# Altium schematic sheet P1.schdoc
size 297 x 209 mm; Symbol: Drawing-Symbol_A4; @Project Name: Macropad; @Page Count: 1; @Update Date: 2026-11-06; @Create Date: 2026-11-06; @Schematic Name: Schematic1; @Page No: 1; @Page Name: P1; Company: EasyEDA.com; Version: V1.0; Page Size: A4; Device: Drawing-Symbol_A4; @Create Time: 21:02:07; @Update Time: 21:02:07; Border: 1; Width: 1170; Height: 825; Region Start: 1; X Region Count: 6; Y Region Count: 4; Blade Width: 10; Title Block Position: 3; @Board Name: Board1
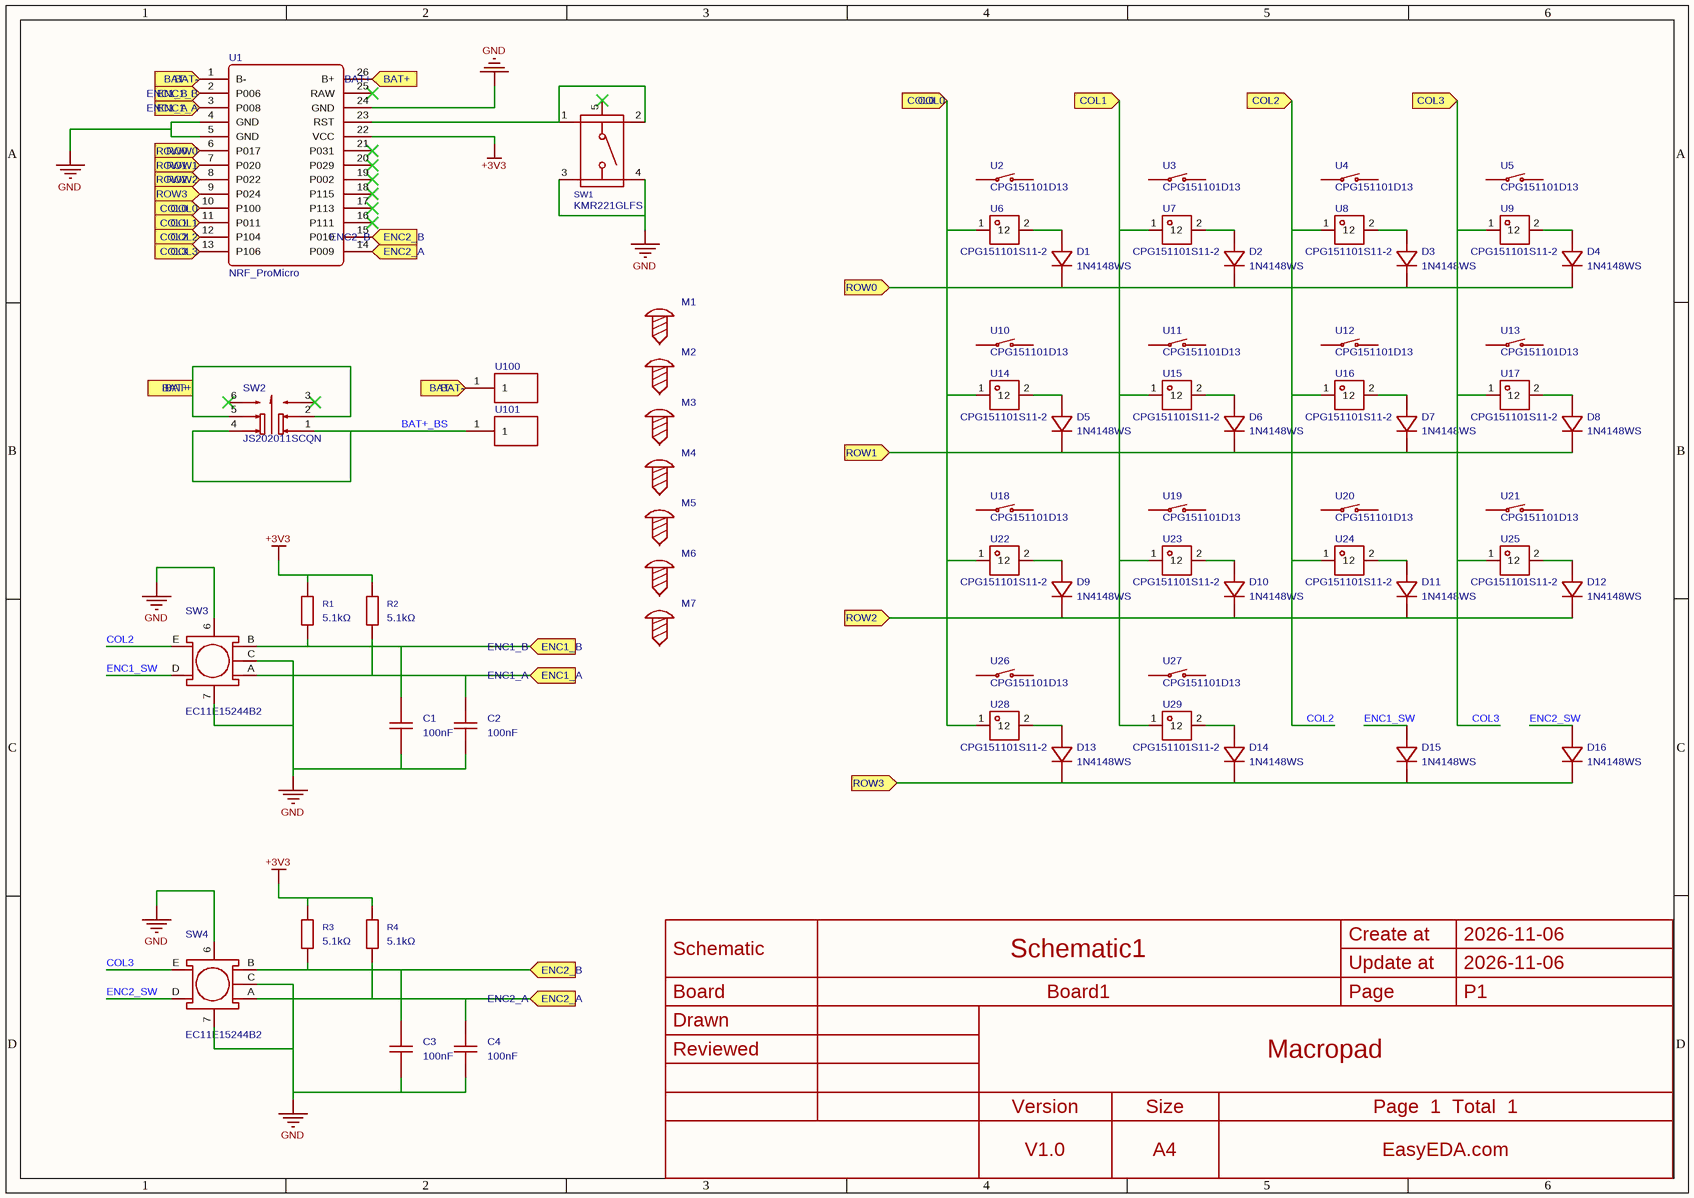
[diagram p0: P1.schdoc]

## Parts
C1  100nF  [C0402]
C2  100nF  [C0402]
C3  100nF  [C0402]
C4  100nF  [C0402]
D1  1N4148WS  [SOD-323_L1.8-W1.3-LS2.5-RD]
D2  1N4148WS  [SOD-323_L1.8-W1.3-LS2.5-RD]
D3  1N4148WS  [SOD-323_L1.8-W1.3-LS2.5-RD]
D4  1N4148WS  [SOD-323_L1.8-W1.3-LS2.5-RD]
D5  1N4148WS  [SOD-323_L1.8-W1.3-LS2.5-RD]
D6  1N4148WS  [SOD-323_L1.8-W1.3-LS2.5-RD]
D7  1N4148WS  [SOD-323_L1.8-W1.3-LS2.5-RD]
D8  1N4148WS  [SOD-323_L1.8-W1.3-LS2.5-RD]
D9  1N4148WS  [SOD-323_L1.8-W1.3-LS2.5-RD]
D10  1N4148WS  [SOD-323_L1.8-W1.3-LS2.5-RD]
D11  1N4148WS  [SOD-323_L1.8-W1.3-LS2.5-RD]
D12  1N4148WS  [SOD-323_L1.8-W1.3-LS2.5-RD]
D13  1N4148WS  [SOD-323_L1.8-W1.3-LS2.5-RD]
D14  1N4148WS  [SOD-323_L1.8-W1.3-LS2.5-RD]
D15  1N4148WS  [SOD-323_L1.8-W1.3-LS2.5-RD]
D16  1N4148WS  [SOD-323_L1.8-W1.3-LS2.5-RD]
M1  (no value)  [Screw-Hole-M2]
M2  (no value)  [Screw-Hole-M2]
M3  (no value)  [Screw-Hole-M2]
M4  (no value)  [Screw-Hole-M2]
M5  (no value)  [Screw-Hole-M3]
M6  (no value)  [Screw-Hole-M3]
M7  (no value)  [Screw-Hole-M3]
R1  5.1kΩ  [R0402]
R2  5.1kΩ  [R0402]
R3  5.1kΩ  [R0402]
R4  5.1kΩ  [R0402]
SW1  KMR221GLFS  [KEY-SMD_KMR2XXGXXX]
SW2  JS202011SCQN  [SW-SMD_JS202011SCQN]
SW3  EC11E15244B2  [SW-TH_EC11XXXXXXXX]
SW4  EC11E15244B2  [SW-TH_EC11XXXXXXXX]
U1  NRF_ProMicro  [NRF_Pro_Micro]
U2  CPG151101D13  [KEY-TH_CPG151101D21X]
U3  CPG151101D13  [KEY-TH_CPG151101D21X]
U4  CPG151101D13  [KEY-TH_CPG151101D21X]
U5  CPG151101D13  [KEY-TH_CPG151101D21X]
U6  CPG151101S11-2  [TH_L10.9-W5.9-CPG151101S11-2]
U7  CPG151101S11-2  [TH_L10.9-W5.9-CPG151101S11-2]
U8  CPG151101S11-2  [TH_L10.9-W5.9-CPG151101S11-2]
U9  CPG151101S11-2  [TH_L10.9-W5.9-CPG151101S11-2]
U10  CPG151101D13  [KEY-TH_CPG151101D21X]
U11  CPG151101D13  [KEY-TH_CPG151101D21X]
U12  CPG151101D13  [KEY-TH_CPG151101D21X]
U13  CPG151101D13  [KEY-TH_CPG151101D21X]
U14  CPG151101S11-2  [TH_L10.9-W5.9-CPG151101S11-2]
U15  CPG151101S11-2  [TH_L10.9-W5.9-CPG151101S11-2]
U16  CPG151101S11-2  [TH_L10.9-W5.9-CPG151101S11-2]
U17  CPG151101S11-2  [TH_L10.9-W5.9-CPG151101S11-2]
U18  CPG151101D13  [KEY-TH_CPG151101D21X]
U19  CPG151101D13  [KEY-TH_CPG151101D21X]
U20  CPG151101D13  [KEY-TH_CPG151101D21X]
U21  CPG151101D13  [KEY-TH_CPG151101D21X]
U22  CPG151101S11-2  [TH_L10.9-W5.9-CPG151101S11-2]
U23  CPG151101S11-2  [TH_L10.9-W5.9-CPG151101S11-2]
U24  CPG151101S11-2  [TH_L10.9-W5.9-CPG151101S11-2]
U25  CPG151101S11-2  [TH_L10.9-W5.9-CPG151101S11-2]
U26  CPG151101D13  [KEY-TH_CPG151101D21X]
U27  CPG151101D13  [KEY-TH_CPG151101D21X]
U28  CPG151101S11-2  [TH_L10.9-W5.9-CPG151101S11-2]
U29  CPG151101S11-2  [TH_L10.9-W5.9-CPG151101S11-2]
U100  (no value)  [Pad2mmx4mm]
U101  (no value)  [Pad2mmx4mm]

## Ports
BAT+ (in), BAT- (in), COL0 (in), COL1 (in), COL2 (in), COL3 (in), ENC1_A (in), ENC1_B (in), ENC2_A (in), ENC2_B (in), ROW0 (in), ROW1 (in), ROW2 (in), ROW3 (in)

## Nets
+3V3: R1.1 R2.1 R3.1 R4.1 U1.22(VCC)
GND: C1.1 C2.1 C3.1 C4.1 SW1.3 SW1.4 SW3.6 SW3.7 SW3.C SW4.6 SW4.7 SW4.C U1.4(GND) U1.5(GND) U1.24(GND)
BAT+: SW2.2 SW2.5 U1.26(B+) ; port BAT+
BAT+_BS: SW2.1 SW2.4 U101.1
BAT-: U1.1(B-) U100.1 ; port BAT-
COL0: U1.10(P100) U6.1 U14.1 U22.1 U28.1 ; port COL0
COL1: U1.11(P011) U7.1 U15.1 U23.1 U29.1 ; port COL1
COL2: SW3.E U1.12(P104) U8.1 U16.1 U24.1 ; port COL2
COL3: SW4.E U1.13(P106) U9.1 U17.1 U25.1 ; port COL3
ENC1_A: C2.2 R2.2 SW3.A U1.3(P008) ; port ENC1_A
ENC1_B: C1.2 R1.2 SW3.B U1.2(P006) ; port ENC1_B
ENC1_SW: D15.2(A) SW3.D
ENC2_A: C4.2 R4.2 SW4.A U1.14(P009) ; port ENC2_A
ENC2_B: C3.2 R3.2 SW4.B U1.15(P010) ; port ENC2_B
ENC2_SW: D16.2(A) SW4.D
ROW0: D1.1(C) D2.1(C) D3.1(C) D4.1(C) U1.6(P017) ; port ROW0
ROW1: D5.1(C) D6.1(C) D7.1(C) D8.1(C) U1.7(P020) ; port ROW1
ROW2: D9.1(C) D10.1(C) D11.1(C) D12.1(C) U1.8(P022) ; port ROW2
ROW3: D13.1(C) D14.1(C) D15.1(C) D16.1(C) U1.9(P024) ; port ROW3
NetD1_2: D1.2(A) U6.2
NetD2_2: D2.2(A) U7.2
NetD3_2: D3.2(A) U8.2
NetD4_2: D4.2(A) U9.2
NetD5_2: D5.2(A) U14.2
NetD6_2: D6.2(A) U15.2
NetD7_2: D7.2(A) U16.2
NetD8_2: D8.2(A) U17.2
NetD9_2: D9.2(A) U22.2
NetD10_2: D10.2(A) U23.2
NetD11_2: D11.2(A) U24.2
NetD12_2: D12.2(A) U25.2
NetD13_2: D13.2(A) U28.2
NetD14_2: D14.2(A) U29.2
NetSW1_1: SW1.1 SW1.2 U1.23(RST)

Not connected (* = marked no-connect by the designer): M1 1; M2 1; M3 1; M4 1; M5 1; M6 1; M7 1; SW1 5*; SW2 3* 6*; U1 16(P111)* 17(P113)* 18(P115)* 19(P002)* 20(P029)* 21(P031)* 25(RAW)*

## Notes on the sheet
- Create at
- 2026-11-06
- Schematic
- Board
- Schematic1
- Board1
- Update at
- Page
- P1
- Drawn
- Reviewed
- Macropad
- Version
- V1.0
- Size
- A4
- Page  1  Total  1
- EasyEDA.com

## Library data of the parts
C1-C4 = CL05B104KB54PNC: Capacitance:100nF Tolerance:±10% Tolerance:±10% Voltage Rating:50V Temperature Coefficient:X7R; Manufacturer: SAMSUNG(三星); AddInBom: yes; ModelId: b7d13df3e9464d7a99d0651d1a5b4d570819f05c4eef4c71ace90d822a990e87; ModelName: C0402_L1.0-W0.5-H0.5; ModelTransform: 39.37,19.685,0,0,0,0,0,0,0; Tolerance: ±10%; Voltage Rating: 50V; Temperature Coefficient: X7R; Symbol: CL05B104KB54PNC; Device: CL05B104KB54PNC; LCSC Part Name: 100nF ±10% 50V; SupplierPart: C307331; ManufacturerPart: CL05B104KB54PNC; Supplier Footprint: 0402; JLCPCB Part Class: Basic Part; Datasheet: https://item.szlcsc.com/datasheet/CL05B104KB54PNC/291005.html; Supplier: LCSC; ConvertToPcb: yes; FootprintName: C0402; Value: 100nF
D1 = 1N4148WS_C917117: Diode Configuration:Standalone Pd - Power Dissipation:200mW Current - Rectified:200mA Voltage - DC Reverse(Vr):75V Voltage - Forward(Vf@If):1.25V@150mA Non-Repetitive Peak Forward Surge Current:2A Reverse Leakage Current (Ir):1uA@75V Reverse Recovery Time; Manufacturer: JSMSEMI(杰盛微); AddInBom: yes; ModelId: 533ebfb2f206414f9035ed0ccba1097d0819f05c4eef4c71ace90d822a990e87; ModelTransform: 104.3305,51.181,0,0,0,0,0,-0.004,0; Pd - Power Dissipation: 200mW; Current - Rectified: 200mA; Voltage - DC Reverse(Vr): 75V; Non-Repetitive Peak Forward Surge Current: 2A; Reverse Recovery Time (trr): 4ns; Operating Junction Temperature Range: -55℃~+150℃; Symbol: 1N4148WS_C917117; Device: 1N4148WS_C917117; LCSC Part Name: 75V 200mA; SupplierPart: C917117; ManufacturerPart: 1N4148WS; Supplier Footprint: SOD-323; JLCPCB Part Class: Extended Part; Datasheet: https://item.szlcsc.com/datasheet/1N4148WS/991613.html; Supplier: LCSC; ConvertToPcb: yes; FootprintName: SOD-323_L1.8-W1.3-LS2.5-RD; ModelName: SOD-323_L1.8-W1.3-LS2.5-RD; Diode Configuration: Standalone; Voltage - Forward(Vf@If): 1.25V@150mA; Reverse Leakage Current (Ir): 1uA@75V
D2-D16 = 1N4148WS_C917117: Diode Configuration:Standalone Pd - Power Dissipation:200mW Current - Rectified:200mA Voltage - DC Reverse(Vr):75V Voltage - Forward(Vf@If):1.25V@150mA Non-Repetitive Peak Forward Surge Current:2A Reverse Leakage Current (Ir):1uA@75V Reverse Recovery Time; Manufacturer: JSMSEMI(杰盛微); 3D Model: 533ebfb2f206414f9035ed0ccba1097d0819f05c4eef4c71ace90d822a990e87; 3D Model Transform: 104.3305,51.181,0,0,0,0,0,-0.004,0; Pd - Power Dissipation: 200mW; Current - Rectified: 200mA; Voltage - DC Reverse(Vr): 75V; Non-Repetitive Peak Forward Surge Current: 2A; Reverse Recovery Time (trr): 4ns; Operating Junction Temperature Range: -55℃~+150℃; AddInBom: yes; Symbol: 1N4148WS_C917117; Device: 1N4148WS_C917117; LCSC Part Name: 75V 200mA; Supplier Part: C917117; Manufacturer Part: 1N4148WS; Supplier Footprint: SOD-323; JLCPCB Part Class: Extended Part; Datasheet: https://item.szlcsc.com/datasheet/1N4148WS/991613.html; Supplier: LCSC; Diode Configuration: Standalone; Voltage - Forward(Vf@If): 1.25V@150mA; Reverse Leakage Current (Ir): 1uA@75V; ConvertToPcb: yes; FootprintName: SOD-323_L1.8-W1.3-LS2.5-RD; ModelName: SOD-323_L1.8-W1.3-LS2.5-RD
M1-M4 = Screw-Hole-M2: AddInBom: yes; Symbol: Screw-Hole; Device: Screw-Hole-M2; ConvertToPcb: yes; Supplier Footprint: 插件; FootprintName: Screw-Hole-M2
M5-M7 = Screw-Hole-M3: ConvertToPcb: yes; Symbol: Screw-Hole; Device: Screw-Hole-M3; AddInBom: yes; Supplier Footprint: 插件; FootprintName: Screw-Hole-M3
R1-R4 = 0402WGF5101TCE: Type:Thick Film Resistor Resistance:5.1kΩ Tolerance:±1% Tolerance:±1% Power(Watts):62.5mW Voltage-Supply(Max):50V Temperature Coefficient:±100ppm/℃ Temperature Coefficient:±100ppm/℃ Operating Temperature:-55℃~+155℃ Operating Temperature:-55℃~+155℃; Manufacturer: UNI-ROYAL(厚声); 3D Model: efdecb7dae4442949d28eecaf748420f0819f05c4eef4c71ace90d822a990e87; 3D Model Transform: 39.37,19.685,0,0,0,0,0,0,0; Tolerance: ±1%; Power(Watts): 62.5mW; Voltage-Supply(Max): 50V; AddInBom: yes; ModelName: R0402_L1.0-W0.5-H0.4; Symbol: 0402WGF5101TCE; Device: 0402WGF5101TCE; LCSC Part Name: 厚膜电阻 5.1kΩ ±1%; Supplier Footprint: 0402; Datasheet: https://item.szlcsc.com/datasheet/0402WGF5101TCE/26648.html; Type: Thick Film Resistor; Temperature Coefficient: ±100ppm/℃; Operating Temperature: -55℃~+155℃; Supplier: LCSC; Manufacturer Part: 0402WGF5101TCE; Supplier Part: C25905; Value: 5.1kΩ; JLCPCB Part Class: Basic Part; ConvertToPcb: yes; FootprintName: R0402
SW1 = KMR221GLFS: Circuit:SPST Actuator Style:Round Button Operating Force:200gf Mounting Style:Brick nogging Switch Length:4.6mm Switch Width:2.8mm Switch Height:1.9mm Contact Current:50mA Voltage Rating (DC):32V With Lamp:- Pin Style:Gull Wing Mechanical Life:- Operating; Manufacturer: C&K; AddInBom: yes; ModelId: 3a2b494b21af49a89e49f1b8920640b50819f05c4eef4c71ace90d822a990e87; ModelName: KEY-SMD_5P-L4.2-W2.8-H1.9-LS4.6-P1.6; ModelTransform: 181.102,111.91088,0,0,0,0,0,-13.071,0; Circuit: SPST; Operating Force: 200gf; Switch Length: 4.6mm; Switch Width: 2.8mm; Switch Height: 1.9mm; Contact Current: 50mA; Voltage Rating (DC): 32V; Symbol: KMR221GLFS; Device: KMR221GLFS; Supplier: LCSC; Supplier Part: C72443; Manufacturer Part: KMR221GLFS; JLCPCB Part Class: Extended Part; LCSC Part Name: 4.6*2.8*1.9mm 立贴 轻触开关; Supplier Footprint: SMD; Datasheet: https://atta.szlcsc.com/upload/public/pdf/source/20181012/C265019_000848423B8E84768868498C37CC451B.pdf; ConvertToPcb: yes; FootprintName: KEY-SMD_KMR2XXGXXX; Actuator Style: Round Button; Mounting Style: Brick nogging; With Lamp: -; Pin Style: Gull Wing; Mechanical Life: -; Operating Temperature: -40℃~+85℃
SW2 = JS202011SCQN: Circuit:DPDT Actuator Style:Rectangular columnar Pin Style:SMDSplicing Switch Height:5.5mm Mounting Style:Brick nogging Current Rating (DC):300mA Voltage Rating (DC):6V Current Rating (AC):- Voltage Rating (AC):- Mechanical Life:5千次 Operating Temperature:; Manufacturer: C&K; AddInBom: yes; ModelId: 026ac03a3b7c4cf9831127f5db2c954a0819f05c4eef4c71ace90d822a990e87; ModelTransform: 354.52134,295.275,0,0,0,0,0,0,0; Circuit: DPDT; Switch Height: 5.5mm; Current Rating (DC): 300mA; Voltage Rating (DC): 6V; Mechanical Life: 5千次; Symbol: JS202011SCQN; Device: JS202011SCQN; LCSC Part Name: JS202011SCQN; SupplierPart: C221666; ManufacturerPart: JS202011SCQN; Supplier Footprint: SMD; JLCPCB Part Class: Extended Part; Datasheet: https://atta.szlcsc.com/upload/public/pdf/source/20180724/C221669_CAC5A84D68C57021DAEFEE02A0886173.pdf; Supplier: LCSC; ConvertToPcb: yes; FootprintName: SW-SMD_JS202011SCQN; ModelName: SW-SMD_JS202011SCQN; Actuator Style: Rectangular columnar; Pin Style: SMDSplicing; Mounting Style: Brick nogging; Current Rating (AC): -; Voltage Rating (AC): -; Operating Temperature: -40℃~+85℃
SW3 SW4 = EC11E15244B2_C470754: Encoder Type:Incremental Number of Detents / Pulses (Incremental):30/15 Output Form:Two-phase output Mounting Type:Straight Current Rating (Max):10mA Rated Voltage (Max):5V Operating Temperature:-40℃~+85℃ Operating Temperature:-40℃~+85℃; Manufacturer: ALPSALPINE(阿尔卑斯阿尔派); 3D Model: 34d0052b40b94bce9e3816cf478199620819f05c4eef4c71ace90d822a990e87; 3D Model Transform: 495.18696,578.739,0,0,0,0,0,0,-137.795; Number of Detents / Pulses (Incremental): 30/15; Current Rating (Max): 10mA; Rated Voltage (Max): 5V; AddInBom: yes; ModelName: SW-TH_EC11XXXXXXXX-L11.7-W12.0-H24.5-P2.5-LS14.5; Symbol: EC11E15244B2; Device: EC11E15244B2_C470754; LCSC Part Name: 11型金属轴型编码器; Supplier Part: C470754; Manufacturer Part: EC11E15244B2; Supplier Footprint: 插件; JLCPCB Part Class: Extended Part; Datasheet: https://item.szlcsc.com/datasheet/EC11E15244B2/476834.html; Supplier: LCSC; Encoder Type: Incremental; Output Form: Two-phase output; Mounting Type: Straight; Operating Temperature: -40℃~+85℃; ConvertToPcb: yes; FootprintName: SW-TH_EC11XXXXXXXX
U1 = NRF_ProMicro: AddInBom: yes; Symbol: NRF_ProMicro; Device: NRF_ProMicro; ConvertToPcb: yes
U2 = CPG151101D13: Axis Type:Blue Switch Operation Force:50gf Conduction Travel:2.2mm Voltage Rating:12V Operating Temperature:-40℃~+70℃ Operating Temperature:-40℃~+70℃; Manufacturer: HanElectricity(瀚源); AddInBom: yes; ModelId: 22105fb3b67d4e778b6cbc994b8f7b7e0819f05c4eef4c71ace90d822a990e87; ModelName: KEY-TH_L15.6-W14.0-H15.3; ModelTransform: 614.172,551.18,0,90,0,0,25,-150,-137.795; Operation Force: 50gf; Conduction Travel: 2.2mm; Voltage Rating: 12V; Symbol: CPG151101D13; Device: CPG151101D13; LCSC Part Name: 青轴; SupplierPart: C49234235; ManufacturerPart: CPG151101D13; Supplier Footprint: 插件; JLCPCB Part Class: Extended Part; Datasheet: https://item.szlcsc.com/datasheet/CPG151101D13/51650377.html; Supplier: LCSC; ConvertToPcb: yes; FootprintName: KEY-TH_CPG151101D21X; Axis Type: Blue Switch; Operating Temperature: -40℃~+70℃
U3-U5 U10-U13 U18-U21 U26 U27 = CPG151101D13: Axis Type:Blue Switch Operation Force:50gf Conduction Travel:2.2mm Voltage Rating:12V Operating Temperature:-40℃~+70℃ Operating Temperature:-40℃~+70℃; Manufacturer: HanElectricity(瀚源); 3D Model: 22105fb3b67d4e778b6cbc994b8f7b7e0819f05c4eef4c71ace90d822a990e87; 3D Model Transform: 614.172,551.18,0,90,0,0,25,-150,-137.795; Operation Force: 50gf; Conduction Travel: 2.2mm; Voltage Rating: 12V; AddInBom: yes; ModelName: KEY-TH_L15.6-W14.0-H15.3; Symbol: CPG151101D13; Device: CPG151101D13; LCSC Part Name: 青轴; Supplier Part: C49234235; Manufacturer Part: CPG151101D13; Supplier Footprint: 插件; JLCPCB Part Class: Extended Part; Datasheet: https://item.szlcsc.com/datasheet/CPG151101D13/51650377.html; Supplier: LCSC; Axis Type: Blue Switch; Operating Temperature: -40℃~+70℃; ConvertToPcb: yes; FootprintName: KEY-TH_CPG151101D21X
U6 = CPG151101S11-2_C49352235: Number of Pins:2 Life:5,000 cycles Operation Force:3000gf Voltage Rating:12V; Manufacturer: HanElectricity(瀚源); AddInBom: yes; ModelId: 2bfeb1828cfe4bcebb28acd50a1b75280819f05c4eef4c71ace90d822a990e87; ModelName: TH_L10.9-W5.9-CPG151101S11; ModelTransform: 570.865,231.8893,0,0,0,0,0,0,-47.244; Operation Force: 3000gf; Voltage Rating: 12V; Symbol: CPG151101S11-2_C49352235; Device: CPG151101S11-2_C49352235; LCSC Part Name: 12V 2; SupplierPart: C49352235; ManufacturerPart: CPG151101S11-2; Supplier Footprint: -; JLCPCB Part Class: Extended Part; Datasheet: https://item.szlcsc.com/datasheet/CPG151101S11-2/51853006.html; Supplier: LCSC; ConvertToPcb: yes; FootprintName: TH_L10.9-W5.9-CPG151101S11-2; Number of Pins: 2; Life: 5,000 cycles
U7-U9 U14-U17 U22-U25 U28 U29 = CPG151101S11-2_C49352235: Number of Pins:2 Life:5,000 cycles Operation Force:3000gf Voltage Rating:12V; Manufacturer: HanElectricity(瀚源); 3D Model: 2bfeb1828cfe4bcebb28acd50a1b75280819f05c4eef4c71ace90d822a990e87; 3D Model Transform: 570.865,231.8893,0,0,0,0,0,0,-47.244; Operation Force: 3000gf; Voltage Rating: 12V; AddInBom: yes; ModelName: TH_L10.9-W5.9-CPG151101S11; Symbol: CPG151101S11-2_C49352235; Device: CPG151101S11-2_C49352235; LCSC Part Name: 12V 2; Supplier Part: C49352235; Manufacturer Part: CPG151101S11-2; Supplier Footprint: -; JLCPCB Part Class: Extended Part; Datasheet: https://item.szlcsc.com/datasheet/CPG151101S11-2/51853006.html; Supplier: LCSC; Number of Pins: 2; Life: 5,000 cycles; ConvertToPcb: yes; FootprintName: TH_L10.9-W5.9-CPG151101S11-2
U100 U101 = Pad 2mmx4mm: AddInBom: yes; Symbol: Pad 2mmx4mm; Device: Pad 2mmx4mm; ConvertToPcb: yes; FootprintName: Pad2mmx4mm